# Altium schematic sheet UI.SchDoc
size A4; SheetNumber: 4; SheetTotal: 7
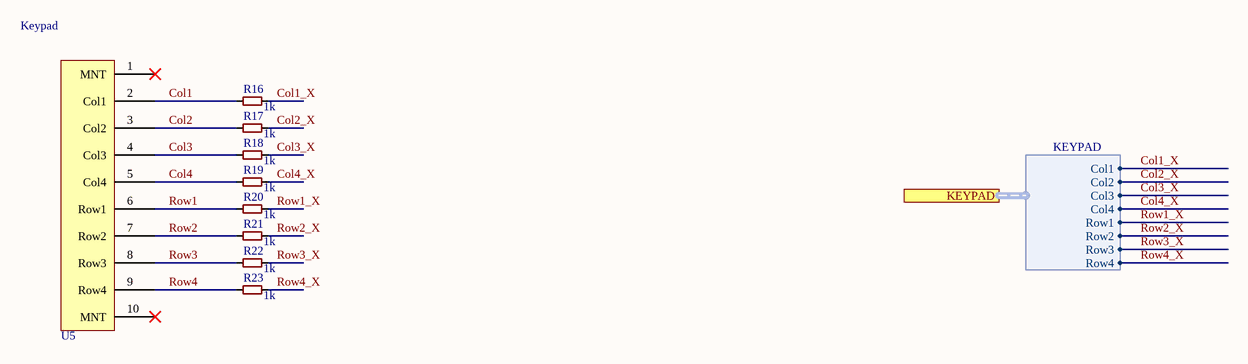
[diagram p0: UI.SchDoc]

## Parts
R16  R: 1k  [0402 Resistor]  (hidden comment: FRC0402F1001TS)
R17  R: 1k  [0402 Resistor]  (hidden comment: FRC0402F1001TS)
R18  R: 1k  [0402 Resistor]  (hidden comment: FRC0402F1001TS)
R19  R: 1k  [0402 Resistor]  (hidden comment: FRC0402F1001TS)
R20  R: 1k  [0402 Resistor]  (hidden comment: FRC0402F1001TS)
R21  R: 1k  [0402 Resistor]  (hidden comment: FRC0402F1001TS)
R22  R: 1k  [0402 Resistor]  (hidden comment: FRC0402F1001TS)
R23  R: 1k  [0402 Resistor]  (hidden comment: FRC0402F1001TS)
U5  ECE 362 Keypad  [ECE 362 Keypad]  (value not drawn)

## Ports
KEYPAD (harness KEYPAD, see Top_Level[2C], RP2350[1B])

## Harnesses
KEYPAD: Col1, Col2, Col3, Col4, Row1, Row2, Row3, Row4

## Nets
Col1: R16.1 U5.2(Col1)
Col1_X: R16.2 ; port KEYPAD.Col1
Col2: R17.1 U5.3(Col2)
Col2_X: R17.2 ; port KEYPAD.Col2
Col3: R18.1 U5.4(Col3)
Col3_X: R18.2 ; port KEYPAD.Col3
Col4: R19.1 U5.5(Col4)
Col4_X: R19.2 ; port KEYPAD.Col4
Row1: R20.1 U5.6(Row1)
Row1_X: R20.2 ; port KEYPAD.Row1
Row2: R21.1 U5.7(Row2)
Row2_X: R21.2 ; port KEYPAD.Row2
Row3: R22.1 U5.8(Row3)
Row3_X: R22.2 ; port KEYPAD.Row3
Row4: R23.1 U5.9(Row4)
Row4_X: R23.2 ; port KEYPAD.Row4

Not connected (* = marked no-connect by the designer): U5 1(MNT)* 10(MNT)*

## Notes on the sheet
- Keypad

## Library data of the parts
R16-R23 = FRC0402F1001TS: RES 1kΩ ±1% 62.5mW 0402; LCSC Part #: C2906864
U5 = ECE 362 Keypad: ECE 362 Keypad, cols are 6,7,8,9.